# Altium schematic sheet Power_Supply_Sheet.SchDoc
size 420 x 297 mm; SheetNumber: 1; SheetTotal: 4
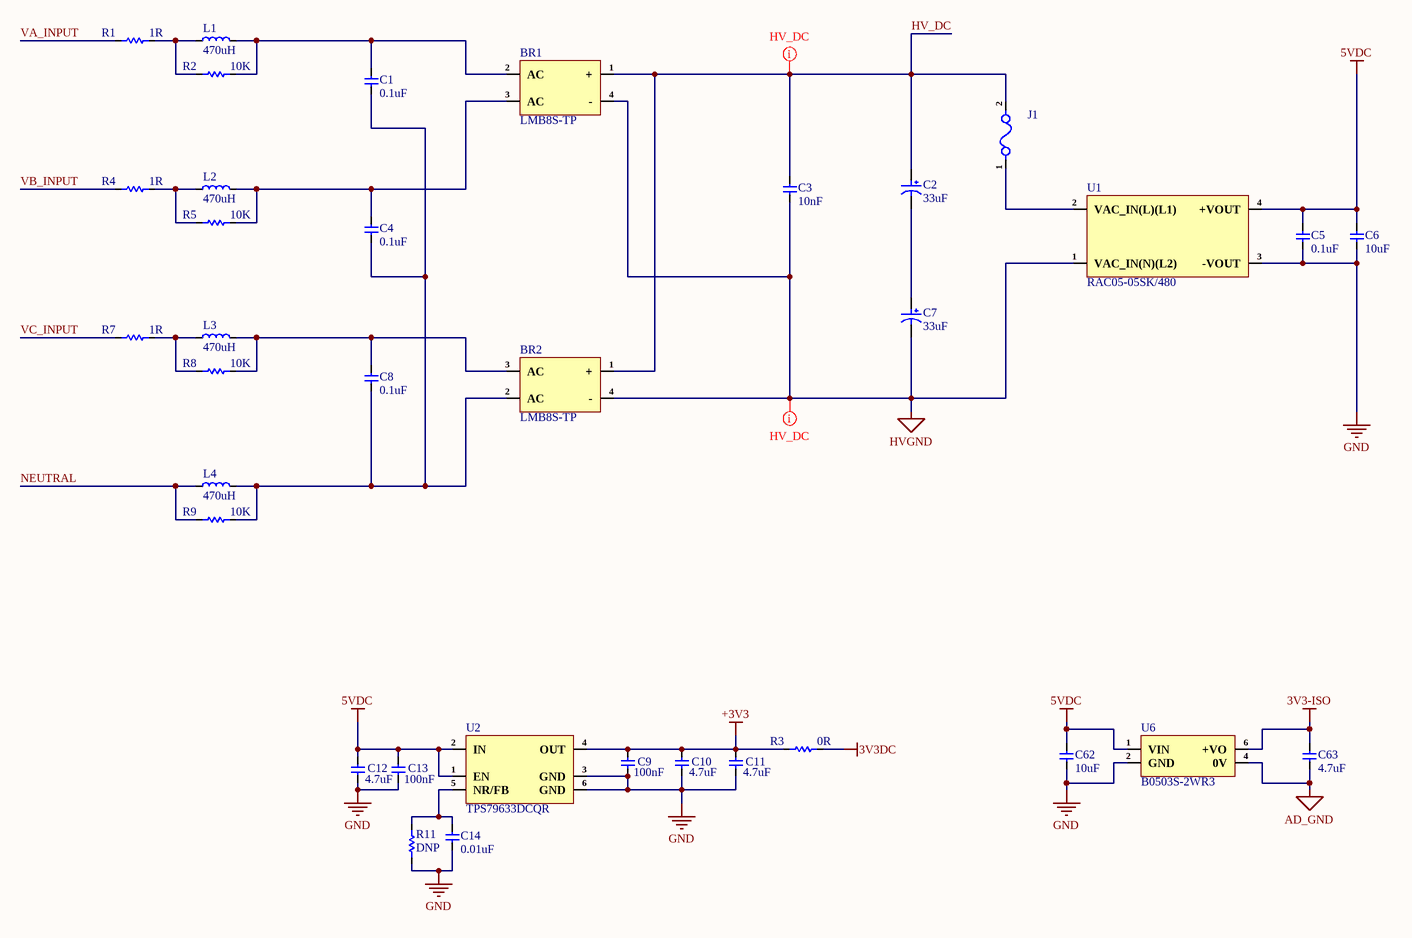
[diagram p0: Power_Supply_Sheet.SchDoc]

## Parts
BR1  LMB8S-TP  [LMBS-1]
BR2  LMB8S-TP  [LMBS-1]
C1  0.1uF  [B32921C3104M000]
C2  33uF  [87EC0494]
C3  10nF  [MPBH103J3A0701]
C4  0.1uF  [B32921C3104M000]
C5  0.1uF  [Cap-0805]
C6  10uF  [Cap-1210]
C7  33uF  [87EC0494]
C8  0.1uF  [B32921C3104M000]
C9  100nF  [Cap-0603]
C10  4.7uF  [Cap-0603]
C11  4.7uF  [Cap-0603]
C12  4.7uF  [Cap-0603]
C13  100nF  [Cap-0603]
C14  0.01uF  [Cap-0603]
C62  10uF  [Cap-0603]
C63  4.7uF  [Cap-0603]
J1  01550900M  [01550900M]  (value not drawn)
L1  470uH  [XRNR6045-470uH/M]
L2  470uH  [XRNR6045-470uH/M]
L3  470uH  [XRNR6045-470uH/M]
L4  470uH  [XRNR6045-470uH/M]
R1  1R  [RES-2512]
R2  10K  [Res-1206]
R3  0R  [Res-0603]
R4  1R  [RES-2512]
R5  10K  [Res-1206]
R7  1R  [RES-2512]
R8  10K  [Res-1206]
R9  10K  [Res-1206]
R11  DNP  [Res-0603]
U1  RAC05-05SK/480  [RAC05-05SK/480]
U2  TPS79633DCQR  [SOT-223-6_]
U6  B0503S-2WR3  [B0503S-2WR3]

## Nets
3V3-ISO: C63.2 U6.6(+VO)
3V3DC: R3.1
5VDC: C5.2 C6.2 C12.2 C13.2 C62.2 U1.4(+VOUT) U2.1(EN) U2.2(IN) U6.1(VIN)
+3V3: C9.2 C10.2 C11.2 R3.2 U2.4(OUT)
AD_GND: C63.1 U6.4(0V)
GND: C5.1 C6.1 C9.1 C10.1 C11.1 C12.1 C13.1 C14.1 C62.1 R11.1 U1.3(-VOUT) U2.3(GND) U2.6(GND) U6.2(GND)
HVGND: BR1.4(-) BR2.4(-) C3.1 C7.2 U1.1(VAC_IN(N)(L2))
HV_DC: BR1.1(+) BR2.1(+) C2.1 C3.2 J1.2
NEUTRAL: L4.1 R9.1
VA_INPUT: R1.1
VB_INPUT: R4.1
VC_INPUT: R7.1
NetBR1_2: BR1.2(AC) C1.2 L1.2 R2.2
NetBR1_3: BR1.3(AC) C4.2 L2.2 R5.2
NetBR2_2: BR2.2(AC) C1.1 C4.1 C8.1 L4.2 R9.2
NetBR2_3: BR2.3(AC) C8.2 L3.2 R8.2
NetC2_2: C2.2 C7.1
NetC14_2: C14.2 R11.2 U2.5(NR/FB)
NetJ1_1: J1.1 U1.2(VAC_IN(L)(L1))
NetL1_1: L1.1 R1.2 R2.1
NetL2_1: L2.1 R4.2 R5.1
NetL3_1: L3.1 R7.2 R8.1

## Layout directives
net class HV_DC: HV_DC, HVGND

## Notes on the sheet
- File:
- Title:
- Date:
- Page
- Num:
- Total:
- Drawn By: Huzaifa Ali

## Library data of the parts
BR1 BR2 = LMB8S-TP: 30A 950mV@400mA 1A 800V LMBS-1 Bridge Rectifiers ROHS; Manufacturer: MCC(Micro Commercial Components); Manufacturer Part Number: LMB8S-TP; Package: LMBS-1; LCSC Part Number: C435904; Item Type: Bridge; ComponentLink1Description: LCSC; ComponentLink1URL: https://www.lcsc.com/product-detail/Bridge-Rectifiers_MCC-Micro-Commercial-Components-LMB8S-TP_C435904.html?s_z=n_MB8S-TP
C1 C4 C8 = B32921C3104M000: CAP FILM 0.1UF 20% 630VDC RADIAL; Manufacturer: TDK EPCOS; Item Type: Film Capacitors; Dielectric Material: Polypropylene; Value: 100nF; Voltage: 630V; Dielectric: PP; Voltage Rating (AC): 305V; Insulation Resistance: 100R; Dissipation Factor: 1%; Lead Diameter: 0.6mm; Lead Length: 6mm; Ratings: X2; Supplier: Rs; LCSC Part Number: C361368; Manufacturer Part Number: B32921C3104M000; RoHS: Yes; Stock: 6670; Pricing: 100=1.997, 250=1.855, 500=1.75, 1000=1.571 (DKK); Mounting Technology: Through Hole; Case/Package: Radial; Pins: 2NUMBER; Min Operating Temperature: -40°C; Max Operating Temperature: 110°C; Tolerance: 20%; Termination: PC Pins; Series: B32921; Voltage Rating (DC): 630V; Length: 13mm; Height: 12mm; Lead Pitch: 10mm; Depth: 6mm; Reach SVHC Compliant: No; RoHS Compliant: Yes; ComponentLink1URL: https://datasheet.ciiva.com/48779/1833206-48779695.pdf?src-supplier=Element14; ComponentLink1Description: https://datasheet.ciiva.com/48779/1833206-48779695.pdf?src-supplier=Element14
C2 C7 = 87EC0494: 33uF 420V 1Ω@100kHz 430mA@100kHz ±20% Plugin,D10xL16mm Aluminum Electrolytic Capacitors - Leaded ROHS; Manufacturer: KNSCHA; Manufacturer Part Number: 87EC0494; Package: Plugin,D10xL16mm; LCSC Part Number: C6718366; Item Type: Capacitor; ComponentLink1Description: LCSC; ComponentLink1URL: https://www.lcsc.com/product-detail/Aluminum-Electrolytic-Capacitors-Leaded_KNSCHA-87EC0494_C6718366.html
C3 = MPBH103J3A0701: 10nF -40℃~+100℃ ±5% 1kV Through Hole,P=7.5mm Film Capacitors RoHS; Manufacturer: KYET; Manufacturer Part Number: MPBH103J3A0701; Package: Through Hole,P=7.5mm; LCSC Part Number: C2928848; Item Type: Capacitor; ComponentLink1Description: LCSC; ComponentLink1URL: https://www.lcsc.com/product-detail/C2928848.html
C5 = CL21B104KBCNNNC: Multilayer Ceramic Capacitor, 0.1 uF, 50 V, ± 10%, X7R, 0805 [2012 Metric]; Manufacturer: Samsung; Value: 100nF; Voltage Rating: 50V; Supplier: Digikey; Supplier Part Number: 1276-1003-1-ND; Manufacturer Part Number: CL21B104KBCNNNC; RoHS: Yes; Category: Ceramic Capacitors; Stock: 2193973; Pricing: 1=0.1, 10=0.042, 50=0.024, 100=0.0186, 500=0.01404, 1000=0.01103 (USD); Mounting Technology: Surface Mount; Case/Package: 0805; Case Code (Metric): 2012; Case Code (Imperial): 0805; Material: Ceramic; Min Operating Temperature: -55°C; Max Operating Temperature: 125°C; Tolerance: 10%; Dielectric: X7R; Packaging: Tape and Reel; Voltage: 50V; Series: CL; Construction: Flat; Voltage Rating (DC): 50V; Length: 2mm; Width: 0.049inch; Height: 0.85mm; Depth: 1.25mm; Thickness: 0.037inch; Radiation Hardening: No; RoHS Compliant: Yes; Lead Free: 5697LeadFree; ComponentLink1URL: https://datasheet.ciiva.com/25710/cl21b104kbcnnnc-25710182.pdf?src-supplier=Digikey; ComponentLink1Description: https://datasheet.ciiva.com/25710/cl21b104kbcnnnc-25710182.pdf?src-supplier=Digikey; ComponentLink2URL: https://datasheet.ciiva.com/29199/454152-da-01-en-vs-kondensator-0805-29199814.pdf?src-supplier=Conrad; ComponentLink2Description: https://datasheet.ciiva.com/29199/454152-da-01-en-vs-kondensator-0805-29199814.pdf?src-supplier=Conrad; Item Type: Capacitor
C6 = CC1210KKX7R9BB106: CAP CER 10UF 50V X7R 1210; Manufacturer: Yageo; Item Type: Capacitors; Tolerance: 10%; Supplier: Farnell; LCSC Part Number: C596319; Manufacturer Part Number: CC1210KKX7R9BB106; RoHS: Yes; Stock: 76; Mounting Technology: Surface Mount; Case/Package: 1210; Case Code (Metric): 3225; Case Code (Imperial): 1210; Min Operating Temperature: -55°C; Max Operating Temperature: 125°C; Value: 10uF; Dielectric: X7R; Packaging: Cut Tape; Voltage Rating: 50V; Voltage Rating (DC): 50V; Series: CC; Length: 0.126inch; Width: 0.098inch; Thickness: 0.11inch; Lead Free: Lead Free; Halogen Free: Halogen Free; RoHS Compliant: Yes; ComponentLink1URL: https://datasheet.octopart.com/CC1210KKX7R9BB106-Yageo-datasheet-147453679.pdf?src-supplier=Newark; ComponentLink1Description: https://datasheet.octopart.com/CC1210KKX7R9BB106-Yageo-datasheet-147453679.pdf?src-supplier=Newark; ComponentLink2URL: https://datasheet.octopart.com/CC1210KKX7R9BB106-Yageo-datasheet-166511530.pdf?src-supplier=Future+Electronics; ComponentLink2Description: https://datasheet.octopart.com/CC1210KKX7R9BB106-Yageo-datasheet-166511530.pdf?src-supplier=Future+Electronics; ComponentLink3URL: http://www.yageo.com/documents/recent/UPY-GPHC_X7R_6.3V-to-50V_18.pdf?src-supplier=Digikey; ComponentLink3Description: http://www.yageo.com/documents/recent/UPY-GPHC_X7R_6.3V-to-50V_18.pdf?src-supplier=Digikey; ComponentLink4URL: http://www.yageo.com/exep/pages/download/literatures/ProductSelectionGuide%202014_Final_2.pdf?src-supplier=Digikey; ComponentLink4Description: http://www.yageo.com/exep/pages/download/literatures/ProductSelectionGuide%202014_Final_2.pdf?src-supplier=Digikey; ComponentLink5URL: https://datasheet.octopart.com/CC1210KKX7R9BB106-Yageo-datasheet-151948686.pdf?src-supplier=Farnell; ComponentLink5Description: https://datasheet.octopart.com/CC1210KKX7R9BB106-Yageo-datasheet-151948686.pdf?src-supplier=Farnell
C9 C13 = CC0603JRX7R8BB104: CAP CER 0.1UF 25V X7R 0603; Manufacturer: Yageo; Tolerance: 5%; Item Type: Capacitors; Manufacturer Part Number: CC0603JRX7R8BB104; RoHS: Yes; Dielectric: X7R; LCSC Part Number: C327087; ComponentLink1Description: https://datasheet.ciiva.com/11465/upy-gphc-x7r-6-3v-to-50v-8-11465031.pdf?src-supplier=Avnet; ComponentLink1URL: https://datasheet.ciiva.com/11465/upy-gphc-x7r-6-3v-to-50v-8-11465031.pdf?src-supplier=Avnet; Supplier: Digikey; Stock: 448767; Pricing: 1=0.1, 10=0.057, 50=0.039, 100=0.0335, 500=0.02436, 1000=0.0215 (USD); Mounting Technology: Surface Mount; Case/Package: 0603; Case Code (Imperial): 0603; Case Code (Metric): 1608; Weight: 7.1E-05oz; Min Operating Temperature: -55°C; Max Operating Temperature: 125°C; Voltage Rating: 25V; Voltage Rating (DC): 25V; Packaging: Tape and Reel; Value: 100nF; Termination: SMD/SMT; Series: CC; Construction: Flat; Length: 1.6mm; Width: 0.031inch; Height: 0.8mm; Thickness: 0.035inch; Lead Free: Lead Free; Halogen Free: Halogen Free; RoHS Compliant: Yes
C10-C12 = CC0603KRX5R7BB475: CAP CER 4.7UF 16V X5R 0603; Manufacturer: Yageo; Item Type: Capacitor; Tolerance: 10%; LCSC Part Number: C277476; Manufacturer Part Number: CC0603KRX5R7BB475; RoHS: Yes; Case/Package: 0603; Case Code (Metric): 1608; Case Code (Imperial): 0603; Weight: 7.1E-05oz; Min Operating Temperature: -55°C; Max Operating Temperature: 85°C; Packaging: Tape and Reel; Voltage Rating: 16V; Dielectric: X5R; Termination: SMD/SMT; Voltage Rating (DC): 16V; Series: CC; Height: 0.8mm; RoHS Compliant: Yes; Halogen Free: Halogen Free; Lead Free: Lead Free; ComponentLink1URL: http://www.mouser.com/ds/2/447/UPY-GPHC_X5R_4V-to-50V_25-1131599.pdf?src-supplier=Mouser; ComponentLink1Description: http://www.mouser.com/ds/2/447/UPY-GPHC_X5R_4V-to-50V_25-1131599.pdf?src-supplier=Mouser; ComponentLink2URL: http://www.yageo.com/documents/recent/UPY-GPHC_X5R_4V-to-50V_25.pdf?src-supplier=Digi-Key; ComponentLink2Description: http://www.yageo.com/documents/recent/UPY-GPHC_X5R_4V-to-50V_25.pdf?src-supplier=Digi-Key; Supplier 1: Digi-Key; Category: Ceramic Capacitors; Stock 1: 547703; Pricing 1: 1=0.20000, 10=0.13800, 50=0.08280, 100=0.06990, 500=0.04784, 1000=0.04233 (USD); Mount: Surface Mount; Capacitance: 4.7uF; Resistor Type: Ceramic; Length: 1.6mm; Width: 0.8mm; Thickness: 0.037inch; Depth: 0.8mm; Supplier Part Number 1: 311-1785-1-ND
C14 = GRM1885C1H103JA01D: CAP CER 10000PF 50V C0G/NP0 0603; Manufacturer: Murata; Material: Ceramic; Tolerance: 5%; Dielectric: C0G; Capacitance: 10nF; Manufacturer Part Number: GRM1885C1H103JA01D; RoHS: Yes; Category: Ceramic Capacitors; Case/Package: 0603; Case Code (Imperial): 0603; Case Code (Metric): 1608; Min Operating Temperature: -55°C; Max Operating Temperature: 125°C; Voltage: 50V; Packaging: Tape and Reel; Voltage Rating: 50V; Package Quantity: 4000; Voltage Rating (DC): 50V; Termination: SMD/SMT; Series: GRM; Length: 1.6mm; Width: 0.8mm; Height: 0.8mm; Depth: 0.8mm; RoHS Compliant: Yes; Lead Free: Lead Free; ComponentLink1URL: https://datasheet.ciiva.com/41860/partnumbering-e-01-41860759.pdf?src-supplier=Digi-Key; ComponentLink1Description: https://datasheet.ciiva.com/41860/partnumbering-e-01-41860759.pdf?src-supplier=Digi-Key; ComponentLink2URL: https://datasheet.ciiva.com/29537/partnumbering-e-01-29537910.pdf?src-supplier=Digi-Key; ComponentLink2Description: https://datasheet.ciiva.com/29537/partnumbering-e-01-29537910.pdf?src-supplier=Digi-Key; Supplier 1: RSComponents; Stock 1: 80000; Pricing 1: 4000=0.03500, 8000=0.03200 (GBP); Mount: Surface Mount; Thickness: 0.035inch; Lead Pitch: 0.5mm; REACH SVHC: No SVHC; Supplier Part Number 1: 1449032
C62 = GRM188Z71A106KA73D: CAP CER 10UF 10V X7R 0603; Manufacturer: Murata; Item Type: Capacitor; Material: 4241ConductorMaterial; Tolerance: 10%; Supplier: Mouser; LCSC Part Number: C2959727; Manufacturer Part Number: GRM188Z71A106KA73D; RoHS: Yes; Stock: 390983; Pricing: 1=0.36, 10=0.155, 50=0.155, 100=0.104, 1000=0.094, 10000=0.065 (USD); Case/Package: 345Case; Min Operating Temperature: -55°C; Max Operating Temperature: 125°C; Value: 10uF; Voltage Rating: 10V; Length: 1.6mm; Width: 800um; Height: 1mm; Thickness: 800um; RoHS Compliant: Yes; ComponentLink1URL: https://datasheet.octopart.com/GRM188Z71A106KA73D-Murata-datasheet-165579666.pdf?src-supplier=TME; ComponentLink1Description: https://datasheet.octopart.com/GRM188Z71A106KA73D-Murata-datasheet-165579666.pdf?src-supplier=TME
C63 = GRM188Z71A475KE15D: CAP CER 4.7UF 10V X7R 0603; Manufacturer: Murata; Item Type: Capacitors; Material: 4241ConductorMaterial; Tolerance: 10%; Supplier: Mouser; LCSC Part Number: C913474; Manufacturer Part Number: GRM188Z71A475KE15D; RoHS: Yes; Stock: 33218; Pricing: 1=0.24, 10=0.1, 50=0.1, 100=0.063, 1000=0.055, 10000=0.041 (USD); Case/Package: 0603; Min Operating Temperature: -55°C; Max Operating Temperature: 125°C; Value: 4.7uF; Voltage Rating: 10V; Length: 1.6mm; Width: 800um; Height: 950um; Thickness: 800um; RoHS Compliant: Yes; ComponentLink1URL: https://datasheet.octopart.com/GRM188Z71A475KE15D-Murata-datasheet-149523299.pdf?src-supplier=Newark; ComponentLink1Description: https://datasheet.octopart.com/GRM188Z71A475KE15D-Murata-datasheet-149523299.pdf?src-supplier=Newark; ComponentLink2URL: https://datasheet.octopart.com/GRM188Z71A475KE15D-Murata-datasheet-165579666.pdf?src-supplier=TME; ComponentLink2Description: https://datasheet.octopart.com/GRM188Z71A475KE15D-Murata-datasheet-165579666.pdf?src-supplier=TME
J1 = 01550900M: FUSE BLOK CARTRIDGE 125V 10A SMD; Manufacturer: Littelfuse; Item Type: Fuse Holders; Supplier: Digikey; LCSC Part Number: C108518; Manufacturer Part Number: 01550900M; RoHS: Yes; Stock: 4038; Pricing: 1=2.5, 5=2.072, 10=1.912, 50=1.586, 100=1.4631, 250=1.31448, 500=1.21164, 1000=1.11633, 5000=1.06138 (USD); Lead Free: 5697LeadFree; Reach SVHC Compliant: 4187SVHC; ComponentLink1URL: https://datasheet.ciiva.com/3812/01550900m-3812998.pdf?src-supplier=Arrow+Electronics; ComponentLink1Description: https://datasheet.ciiva.com/3812/01550900m-3812998.pdf?src-supplier=Arrow+Electronics
L1-L4 = XRNR6045-470uH/M: 420mA 470uH Magnetic Shielded Inductor ±20% 500mA 1.8Ω SMD,6x6mm Fixed Inductors ROHS; Manufacturer: XR; Manufacturer Part Number: XRNR6045-470uH/M; Package: SMD,6x6mm; LCSC Part Number: C5339751; Item Type: Inductor
R1 R4 R7 = HoLRT2512-3W-1R-1: 3W 1Ω SMD ±50ppm/℃ Current Sense Resistor ±1% 2512 Chip Resistor - Surface Mount RoHS; Manufacturer: Milliohm; Manufacturer Part Number: HoLRT2512-3W-1R-1; Package: 2512; LCSC Part Number: C5127857; Item Type: Resistor; ComponentLink1Description: LCSC; ComponentLink1URL: https://www.lcsc.com/product-detail/C5127857.html
R2 R5 R8 R9 = AC1206FR-7W10KL: RES 10K OHM 1% 1/2W 1206; Manufacturer: Yageo; Item Type: Resistors; Value: 10kR; Supplier: Mouser; LCSC Part Number: C326700; Manufacturer Part Number: AC1206FR-7W10KL; RoHS: No; Stock: 10222; Pricing: 1=0.14, 10=0.052, 50=0.052, 100=0.029, 1000=0.018, 10000=0.011 (USD); Case/Package: 340Case; Packaging: 10Packaging
R3 R11 = RC0603JR-070RL: RES 0 OHM JUMPER 1/10W 0603; Manufacturer: Yageo; Resistance: 0mR; Tolerance: 1%; Power Rating: 100mW; Voltage Rating (DC): 50V; Temperature Coefficient: 200ppm/°C; Resistance Tolerance: 5%; Item Type: Resistor; Supplier 1: Digi-Key; Manufacturer Part Number: RC0603JR-070RL; RoHS: Yes; Category: Chip SMD Resistors; Stock 1: 18081776; Pricing 1: 1=0.10000, 10=0.01700, 25=0.01240, 50=0.00960, 100=0.00700, 250=0.00536, 500=0.00430, 1000=0.00316 (USD); Case/Package: 0603; Number of Pins: 2; Contact Plating: Tin,Matte; Case Code (Imperial): 0603; Case Code (Metric): 1608; Size Code: 0603; Min Operating Temperature: -55°C; Max Operating Temperature: 155°C; Resistor Type: Thick Film; Packaging: Tape and Reel; Termination: SMD/SMT; Series: RC; Technology: THICK FILM; Package Quantity: 5000; Voltage Rating: 50V; Features: Moisture Resistant; Max Power Dissipation: 100mW; Number of Terminations: 2; Construction: Rectangular; Length: 1.6mm; Width: 0.8mm; Height: 0.45mm; Depth: 0.8mm; Radiation Hardening: No; Reach SVHC Compliant: No SVHC; Lead Free: Lead Free; RoHS Compliant: Yes; Military Standard: Not; Supplier Part Number 1: 311-0.0GRCT-ND; LCSC Part Number: C95177
U1 = RAC05-05SK/480: AC/DC CONVERTER 5V 5W; Manufacturer: Recom Power; Item Type: Voltage Regulators - Switching; Approvals: CE, EN, IEC, UL; Efficiency: 63%; Max Supply Voltage: 528V; Max Output current: 1A; Max Output Voltage: 5.05V; Min Input Voltage: 85V; Min Output Voltage: 4.95V; Nominal Supply Voltage: 480V; Number of Circuits: 1; Supplier: DigiKey; Supplier Part Number: 945-3185-ND; Manufacturer Part Number: RAC05-05SK/480; RoHS: Compliant; Stock: 856; Pricing: 1=18.3, 5=17.424, 10=17.063, 25=16.596, 50=16.251, 100=15.9134, 250=15.47772, 500=15.15614 (USD); Height: 23mm; Height - Seated (Max): 23.5mm; Length: 52.5mm; Lifecycle Status: Production; Max Operating Temperature: 60°C; Max Output Power: 5W; Min Operating Temperature: -40°C; Nominal Output Voltage: 5V; Number of Outputs: 1; Number of Terminals: 4; Output Current: 1A; Output Power: 5W; Output Voltage: 5V; REACH SVHC: Yes; Schedule B: 8504409580; Weight: 58g; Width: 27.4mm; ComponentLink1URL: https://datasheet.octopart.com:443/RAC05-05SK-480-Recom-Power-datasheet-181184451.pdf?src-supplier=IHS; ComponentLink1Description: https://datasheet.octopart.com:443/RAC05-05SK-480-Recom-Power-datasheet-181184451.pdf?src-supplier=IHS; ComponentLink2URL: https://datasheet.octopart.com:443/RAC05-05SK-480-Recom-Power-datasheet-133924410.pdf?src-supplier=Farnell; ComponentLink2Description: https://datasheet.octopart.com:443/RAC05-05SK-480-Recom-Power-datasheet-133924410.pdf?src-supplier=Farnell; ComponentLink3URL: https://datasheet.octopart.com:443/RAC05-05SK-480-Recom-Power-datasheet-148822129.pdf?src-supplier=Electro+Sonic; ComponentLink3Description: https://datasheet.octopart.com:443/RAC05-05SK-480-Recom-Power-datasheet-148822129.pdf?src-supplier=Electro+Sonic; ComponentLink4URL: https://datasheet.octopart.com:443/RAC05-05SK-480-Recom-Power-datasheet-138144762.pdf?src-supplier=RS+(Formerly+Allied+Electronics); ComponentLink4Description: https://datasheet.octopart.com:443/RAC05-05SK-480-Recom-Power-datasheet-138144762.pdf?src-supplier=RS+(Formerly+Allied+Electronics); ComponentLink5URL: https://datasheet.octopart.com:443/RAC05-05SK-480-Recom-Power-datasheet-165581948.pdf?src-supplier=TME; ComponentLink5Description: https://datasheet.octopart.com:443/RAC05-05SK-480-Recom-Power-datasheet-165581948.pdf?src-supplier=TME
U2 = TPS79633DCQR: IC REG LINEAR 3.3V 1A SOT223-6; Manufacturer: Texas Instruments; Supplier: Mouser; Supplier Part Number: 595-TPS79633DCQR; Manufacturer Part Number: TPS79633DCQR; RoHS: Yes; Category: Voltage Regulators - Linear; Stock: 3089; Pricing: 1=3.24, 10=2.75, 50=2.75, 100=2.39, 1000=1.72, 10000=1.56 (USD); Length: 6.5mm; Width: 3.5mm; Thickness: 1.6mm; ComponentLink1URL: https://datasheet.ciiva.com/2045/tps79601-2045264.pdf?src-supplier=Digi-Key; ComponentLink1Description: https://datasheet.ciiva.com/2045/tps79601-2045264.pdf?src-supplier=Digi-Key; ComponentLink2URL: https://datasheet.ciiva.com/22704/1846966-22704703.pdf?src-supplier=Element14; ComponentLink2Description: https://datasheet.ciiva.com/22704/1846966-22704703.pdf?src-supplier=Element14; ComponentLink3URL: https://datasheet.ciiva.com/41462/001015136-da-01-en-ic-reg-ldo-3-3v-1-tps79633dcqr-sot-6-tid-41462982.pdf?src-supplier=Conrad; ComponentLink3Description: https://datasheet.ciiva.com/41462/001015136-da-01-en-ic-reg-ldo-3-3v-1-tps79633dcqr-sot-6-tid-41462982.pdf?src-supplier=Conrad; LCSC Part Number: C485803; Item Type: IC
U6 = B0503S-2WR3: SIP-4 Isolated Power Modules ROHS; Manufacturer: YLPTEC; Item Type: Module; Manufacturer Part Number: B0503S-2WR3; Package: SIP-4; LCSC Part Number: C5369472; ComponentLink1Description: LCSC; ComponentLink1URL: https://www.lcsc.com/product-detail/Isolated-Power-Modules_YLPTEC-B0503S-2WR3_C5369472.html?s_z=n_B0503S-2WR3